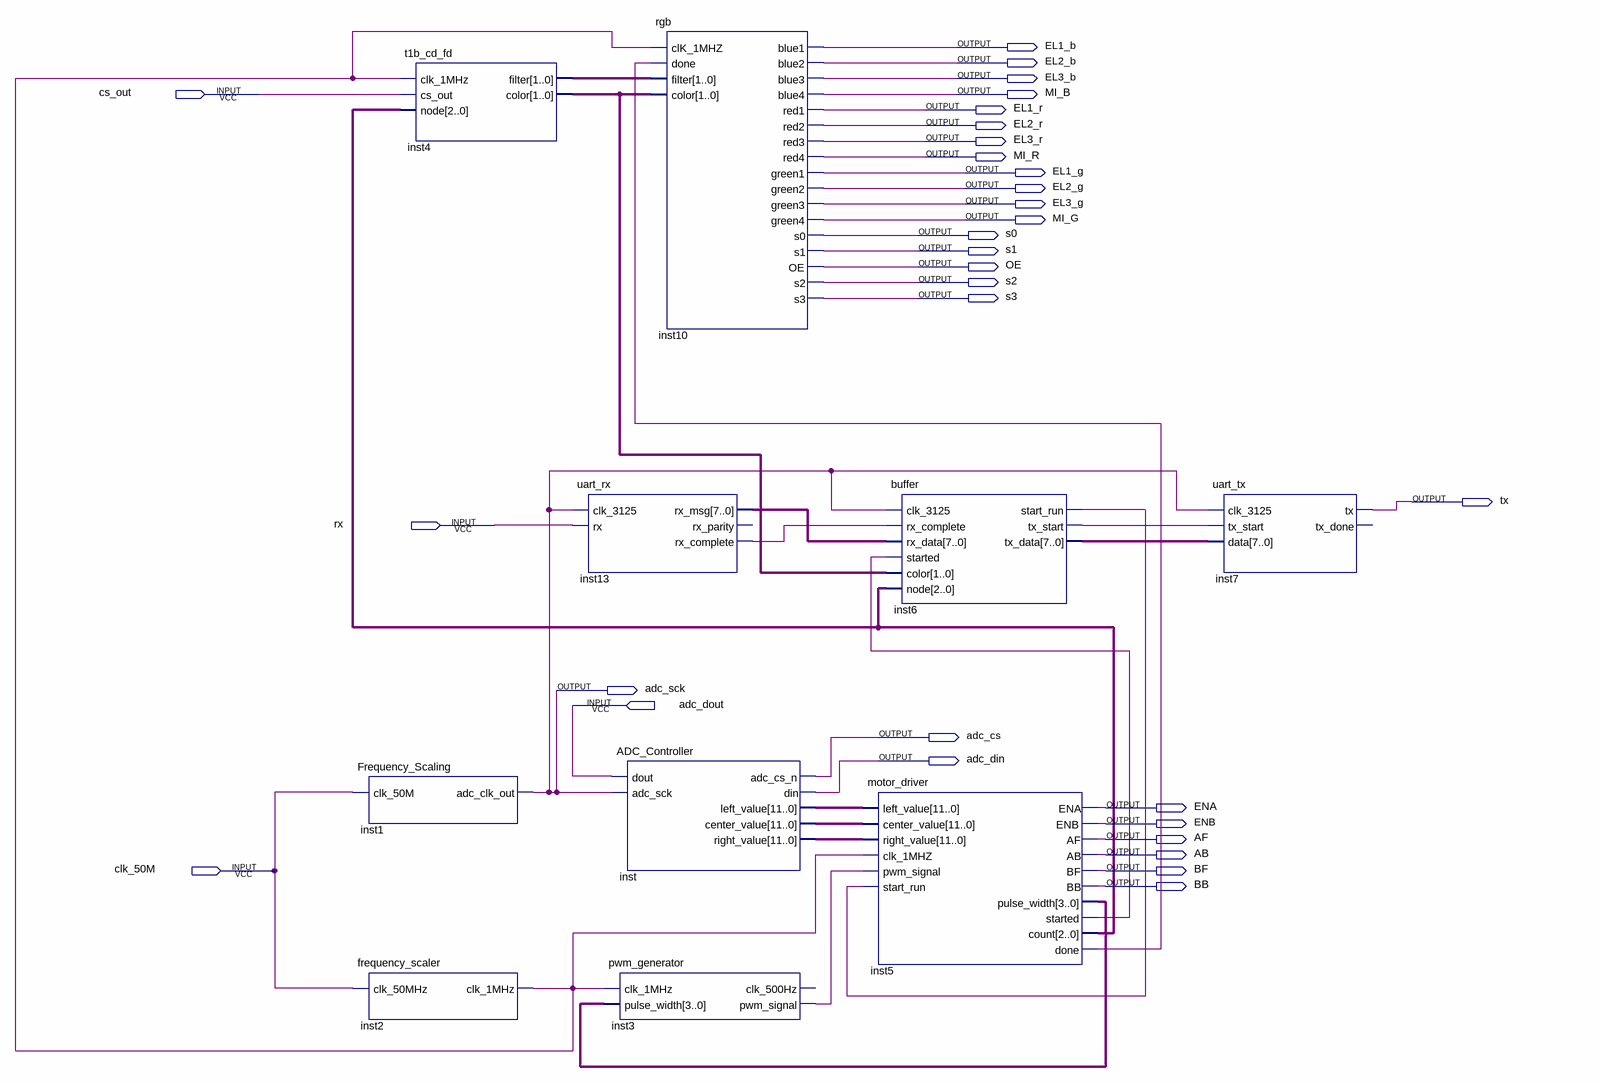
[diagram p0: schematic sheet]
// Quartus schematic LINE_FOLLOWER.bdf as structural Verilog: 10 symbols, 31 pins
module LINE_FOLLOWER (
  input  cs_out,
  input  rx,
  input  adc_dout,
  input  clk_50M,
  output EL1_b,
  output EL2_b,
  output EL3_b,
  output MI_B,
  output EL1_r,
  output EL2_r,
  output EL3_r,
  output MI_R,
  output EL1_g,
  output EL2_g,
  output EL3_g,
  output MI_G,
  output s0,
  output s1,
  output OE,
  output s2,
  output s3,
  output tx,
  output adc_sck,
  output adc_cs,
  output adc_din,
  output ENA,
  output ENB,
  output AF,
  output AB,
  output BF,
  output BB
);

  wire inst2_clk_1mhz, inst3_pwm_signal, inst5_done, inst5_started, inst6_start_run, inst6_tx_start,
       inst13_rx_complete;
  wire [1:0] inst4_color, inst4_filter;
  wire [2:0] inst5_count;
  wire [3:0] inst5_pulse_width;
  wire [7:0] inst6_tx_data, inst13_rx_msg;
  wire [11:0] inst_center_value, inst_left_value, inst_right_value;

  Frequency_Scaling inst1 (.clk_50M(clk_50M), .adc_clk_out(adc_sck));
  frequency_scaler inst2 (.clk_50MHz(clk_50M), .clk_1MHz(inst2_clk_1mhz));
  t1b_cd_fd inst4 (
    .clk_1MHz(inst2_clk_1mhz), .cs_out(cs_out), .node(inst5_count), .filter(inst4_filter), .color(inst4_color));
  uart_rx inst13 (
    .clk_3125(adc_sck), .rx(rx), .rx_msg(inst13_rx_msg), .rx_complete(inst13_rx_complete));  // open: rx_parity
  ADC_Controller inst (
    .dout(adc_dout), .adc_sck(adc_sck), .adc_cs_n(adc_cs), .din(adc_din), .left_value(inst_left_value),
    .center_value(inst_center_value), .right_value(inst_right_value));
  pwm_generator inst3 (
    .clk_1MHz(inst2_clk_1mhz), .pulse_width(inst5_pulse_width), .pwm_signal(inst3_pwm_signal));  // open: clk_500Hz
  rgb inst10 (
    .clK_1MHZ(inst2_clk_1mhz), .done(inst5_done), .filter(inst4_filter), .color(inst4_color), .blue1(EL1_b),
    .blue2(EL2_b), .blue3(EL3_b), .blue4(MI_B), .red1(EL1_r), .red2(EL2_r), .red3(EL3_r), .red4(MI_R),
    .green1(EL1_g), .green2(EL2_g), .green3(EL3_g), .green4(MI_G), .s0(s0), .s1(s1), .OE(OE), .s2(s2), .s3(s3));
  buffer inst6 (
    .clk_3125(adc_sck), .rx_complete(inst13_rx_complete), .rx_data(inst13_rx_msg), .started(inst5_started),
    .color(inst4_color), .node(inst5_count), .start_run(inst6_start_run), .tx_start(inst6_tx_start),
    .tx_data(inst6_tx_data));
  motor_driver inst5 (
    .left_value(inst_left_value), .center_value(inst_center_value), .right_value(inst_right_value),
    .clk_1MHZ(inst2_clk_1mhz), .pwm_signal(inst3_pwm_signal), .start_run(inst6_start_run), .ENA(ENA),
    .ENB(ENB), .AF(AF), .AB(AB), .BF(BF), .BB(BB), .pulse_width(inst5_pulse_width), .started(inst5_started),
    .count(inst5_count), .done(inst5_done));
  uart_tx inst7 (.clk_3125(adc_sck), .tx_start(inst6_tx_start), .data(inst6_tx_data), .tx(tx));  // open: tx_done
endmodule
